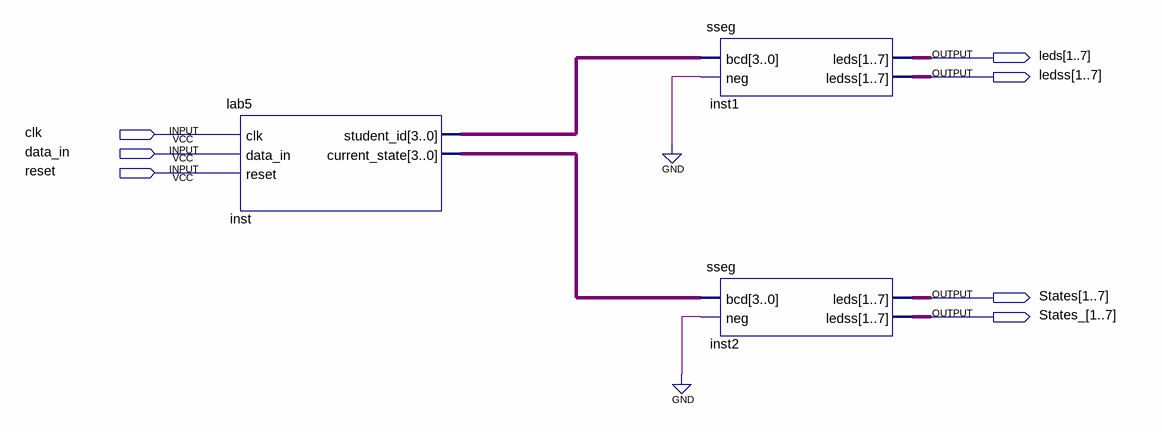
[diagram p0: schematic sheet]
// Quartus schematic mealy.bdf as structural Verilog: 3 symbols, 7 pins
module mealy (
  input  clk,
  input  data_in,
  input  reset,
  output [1:7] leds,
  output [1:7] ledss,
  output [1:7] States,
  output [1:7] States_
);

  wire [3:0] inst_current_state, inst_student_id;

  lab5 inst (
    .clk(clk), .data_in(data_in), .reset(reset), .student_id(inst_student_id),
    .current_state(inst_current_state));
  sseg inst1 (.bcd(inst_student_id), .neg(1'b0), .leds(leds), .ledss(ledss));
  sseg inst2 (.bcd(inst_current_state), .neg(1'b0), .leds(States), .ledss(States_));
endmodule
